# EasyEDA Pro project esp-college-project_bkymsryt-aeef78a5.epro, schematic SCH-ESP-SensairShuttle-MainBoard-V1_1

## Sheets
1 Interface: Board Name: ESP-SensairShuttle-MainBoard-V1_0; Create Date: 2025-10-17; Page Name: Interface; Project Name: ESP-SensairShuttle; Schematic Name: SCH-ESP-SensairShuttle-MainBoard-V1_0; Update Date: 2025-12-12; Company: Espressif
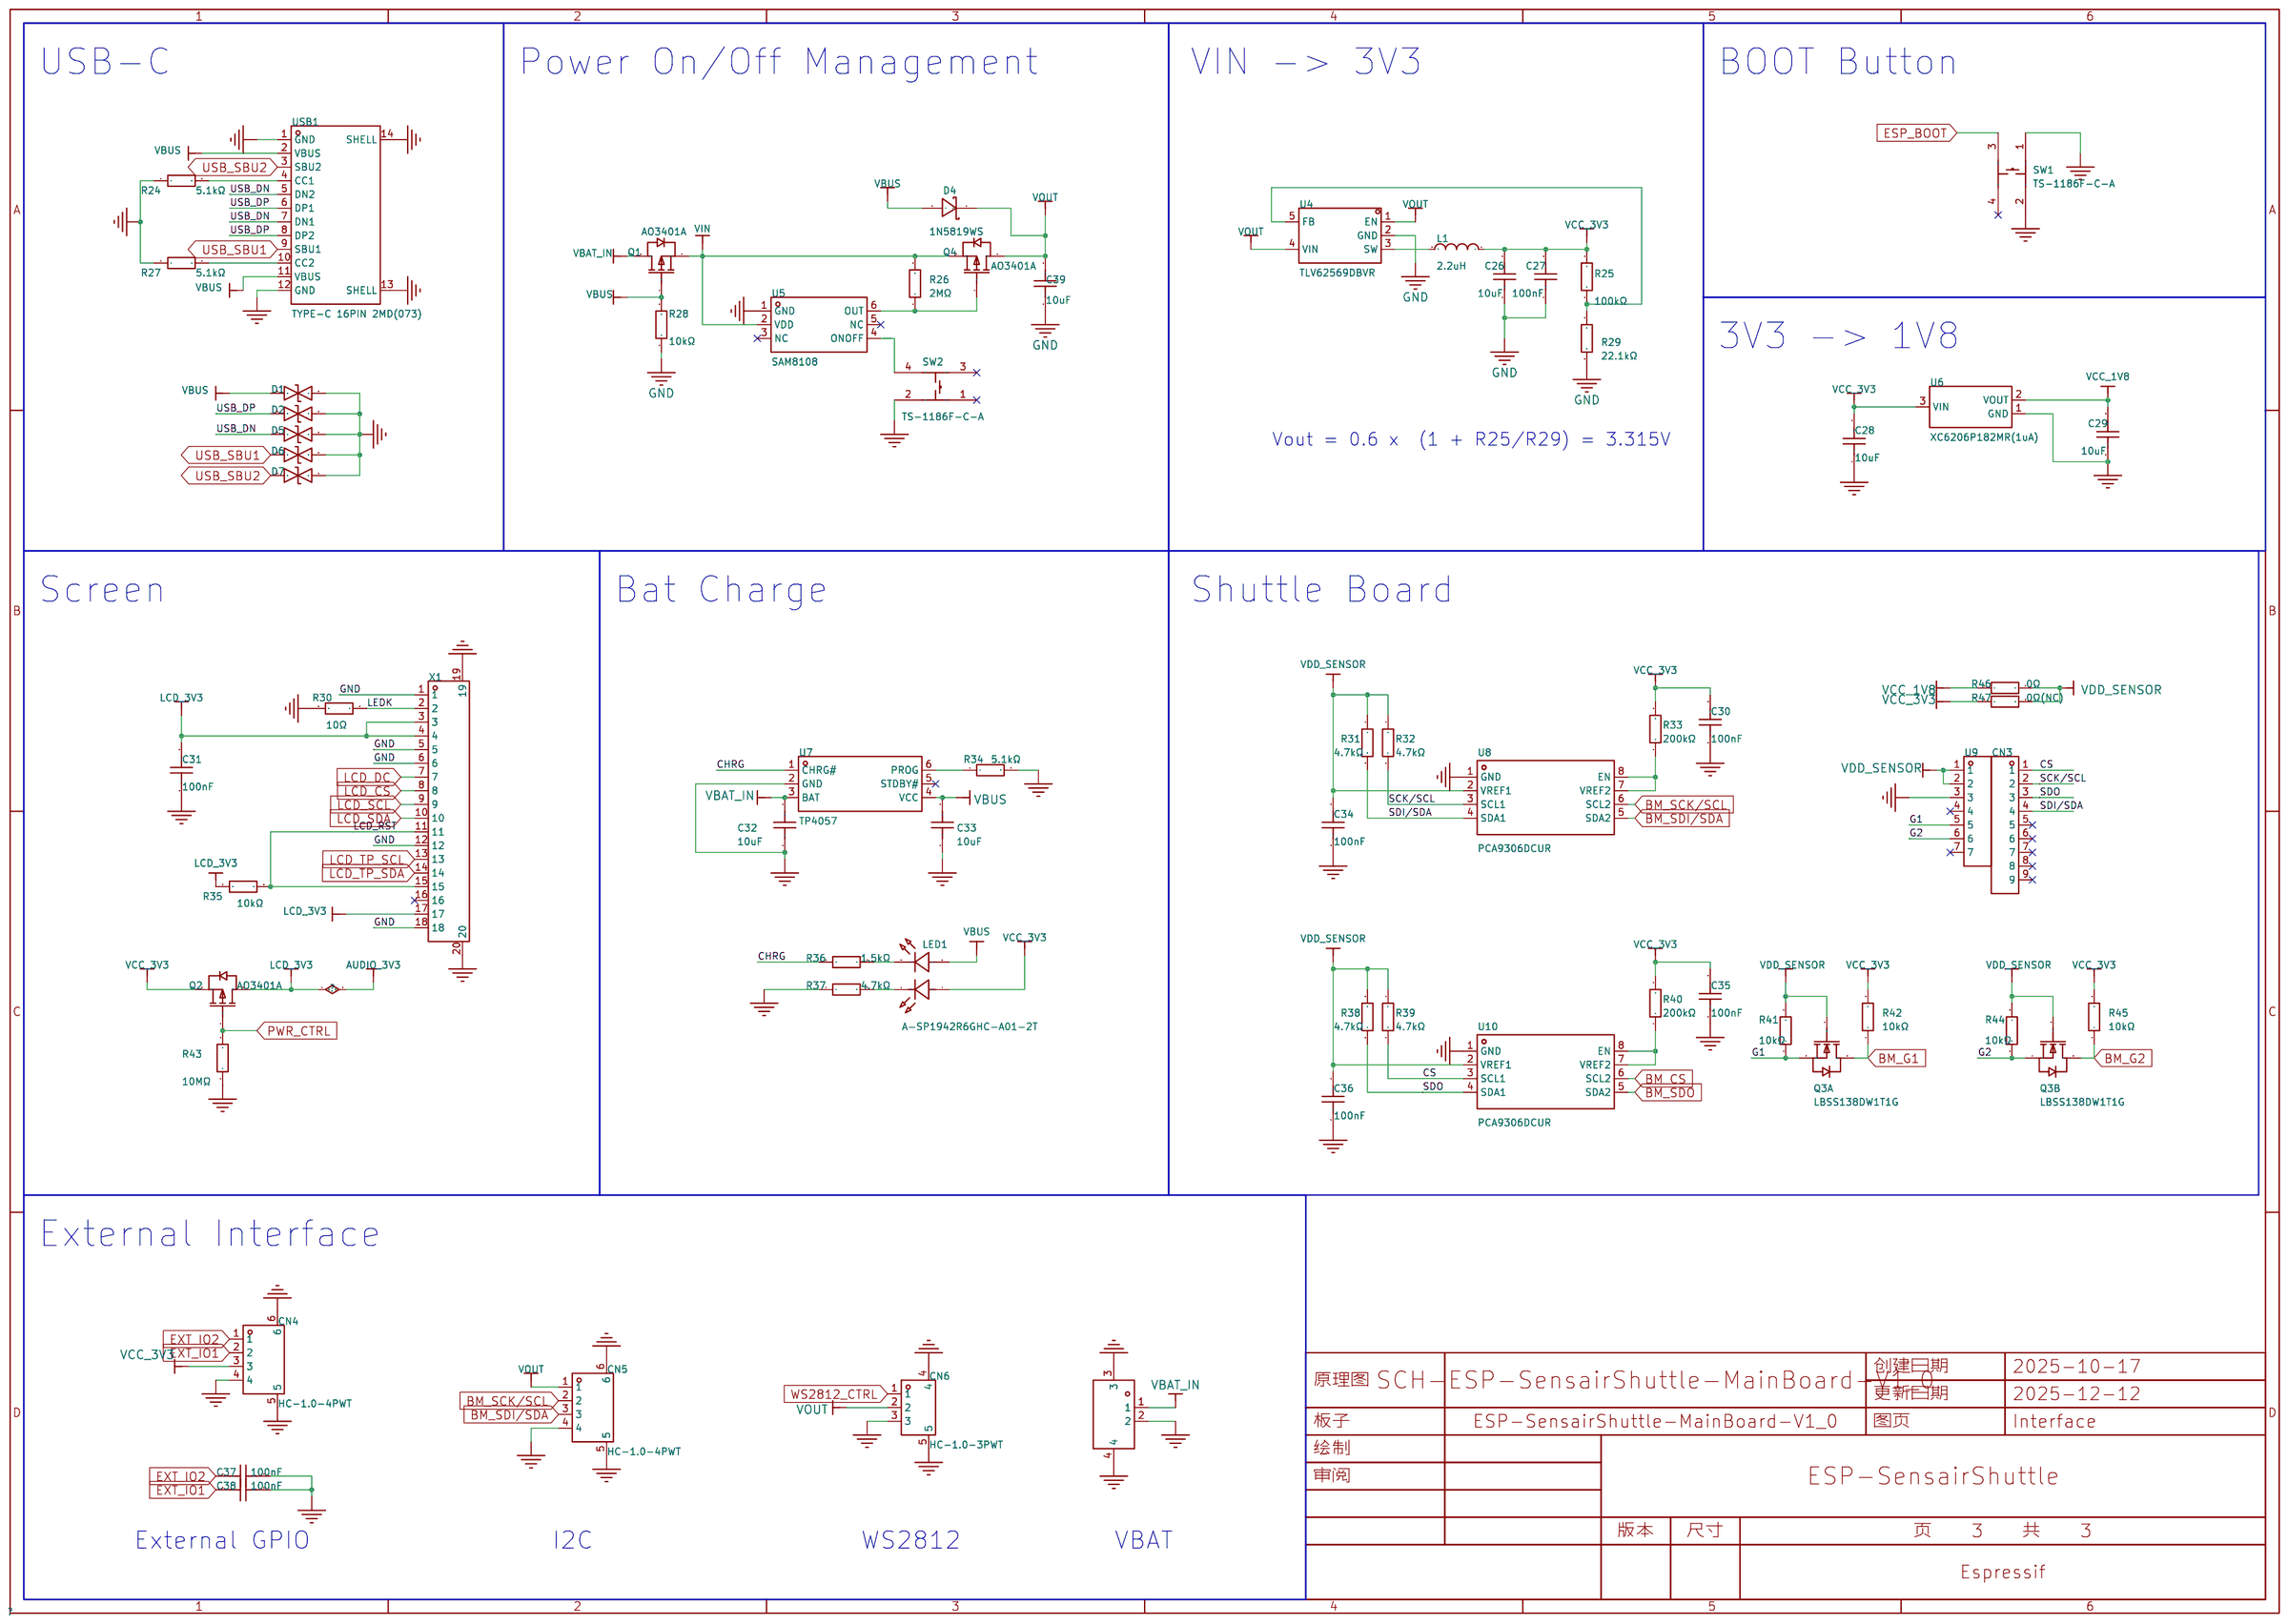
[diagram p1: Interface]
2 MCU & Audio: Page Name: MCU & Audio
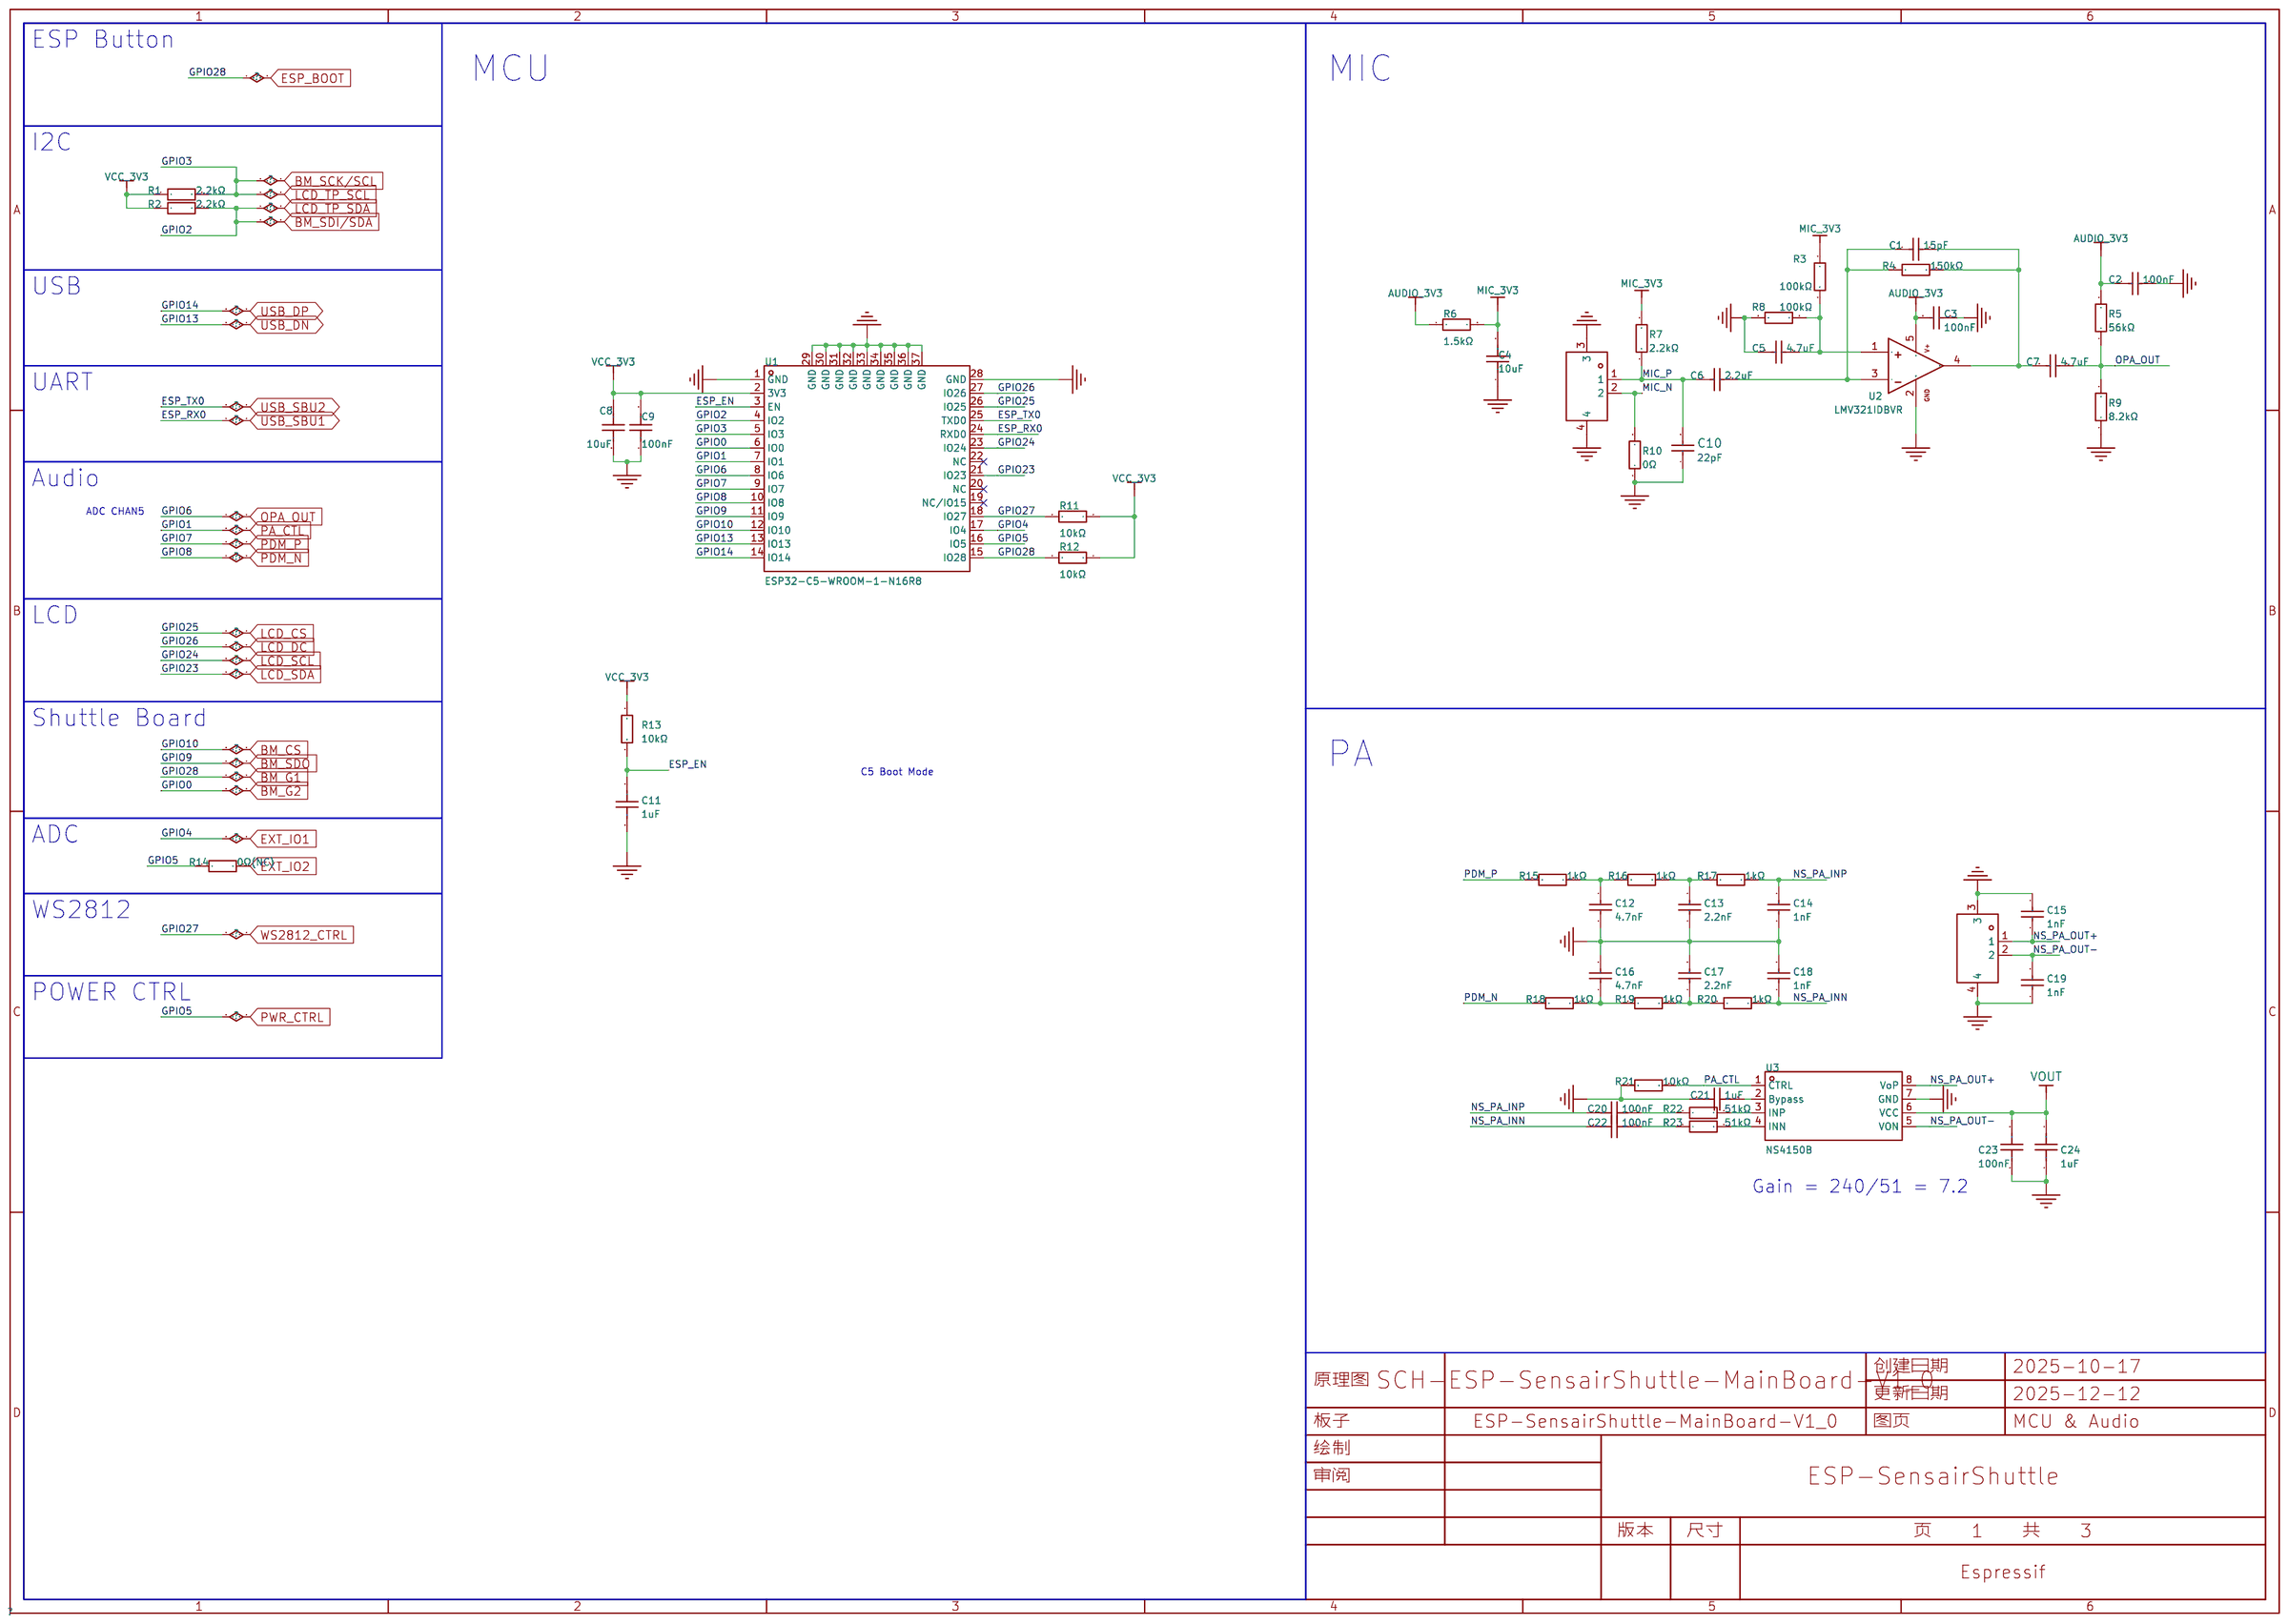
[diagram p2: MCU & Audio]
3 Block: Create Date: 2025-12-12; Page Name: Block; Update Date: 2025-12-16
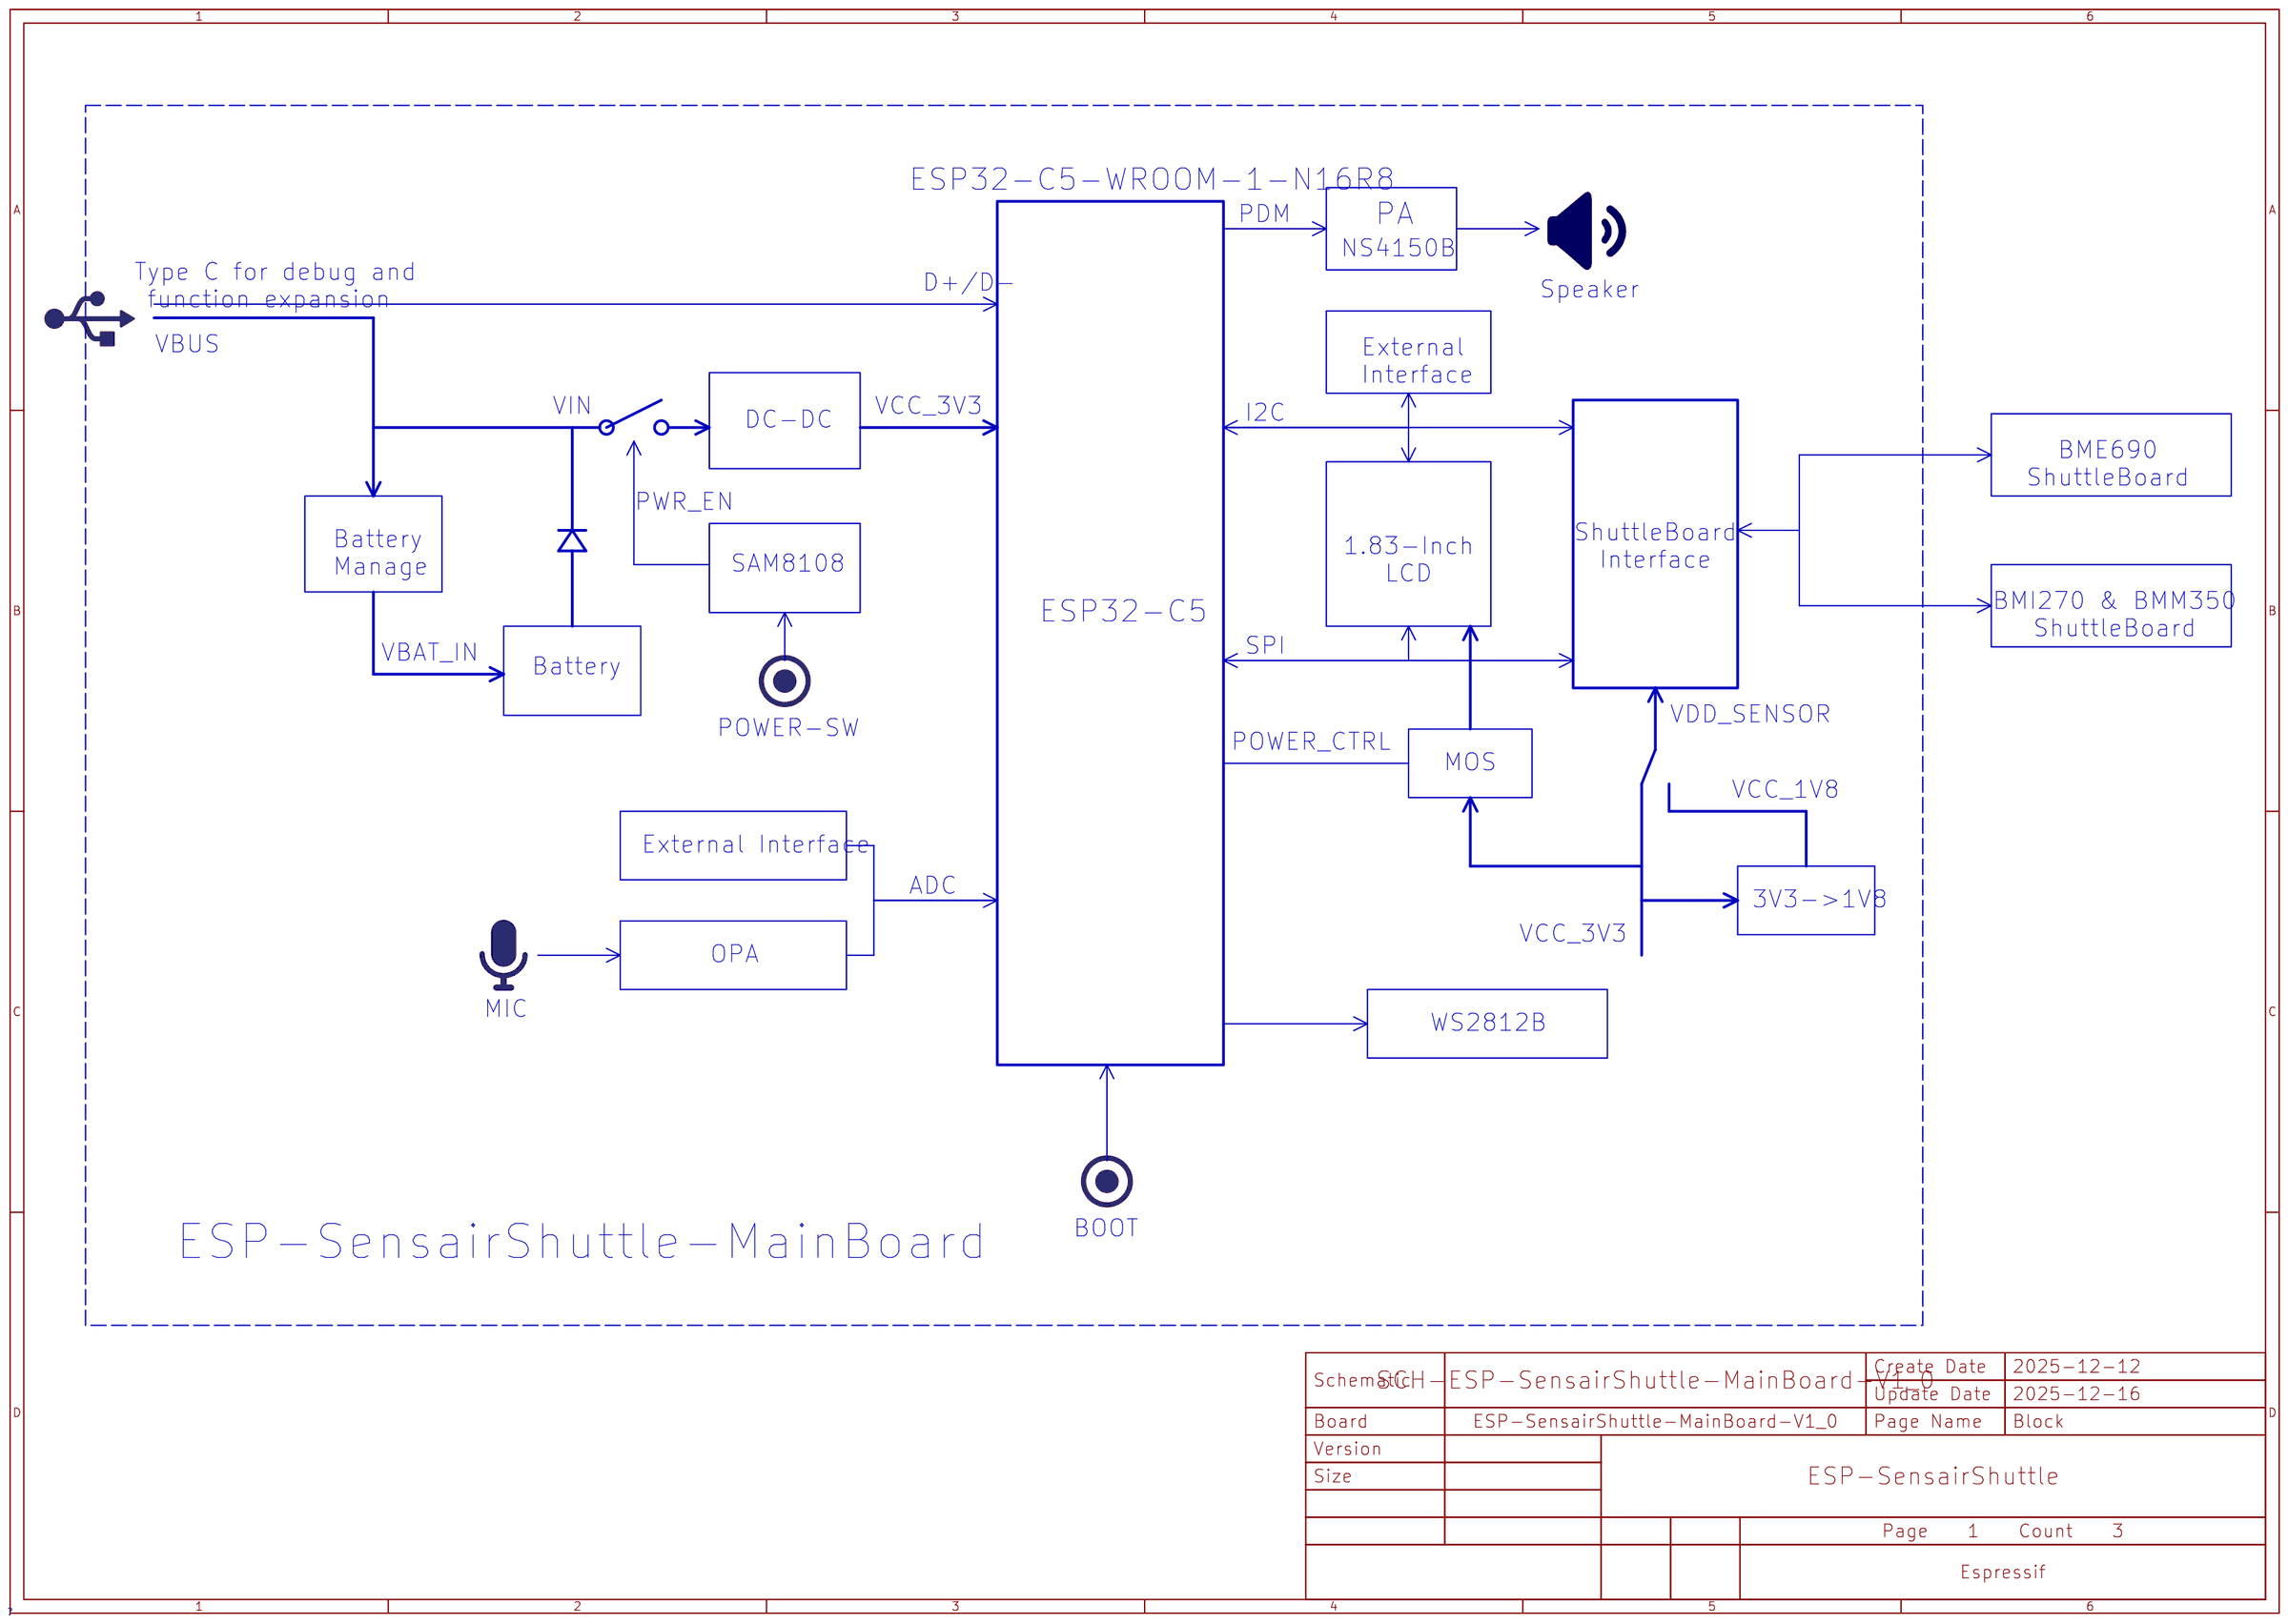
[diagram p3: Block]

## Parts
sheet Interface
C26  10uF  [C0402]
C27  100nF  [C0402]
C28  10uF  [C0402]
C29  10uF  [C0402]
C30  100nF  [C0402]
C31  100nF  [C0402]
C32  10uF  [C0402]
C33  10uF  [C0402]
C34  100nF  [C0402]
C35  100nF  [C0402]
C36  100nF  [C0402]
C37  100nF  [C0402]
C38  100nF  [C0402]
C39  10uF  [C0402]
CN3  X1311FVS-09-C43D35R1  [HDR-SMD_9P-P1.27-V-F_R1]
CN4  HC-1.0-4PWT  [CONN-SMD_4P-P1.00_HCTL_HC-1.0-4PWT]
CN5  HC-1.0-4PWT  [CONN-SMD_4P-P1.00_HCTL_HC-1.0-4PWT]
CN6  HC-1.0-3PWT  [CONN-SMD_3P-P1.0-HC-1.0-3PWT]
CN7  HC-1.25-2PWT  [CONN-SMD_2P-P1.25-HC-1.25-2PWT]
D1  LESD5D5.0CT1G  [SOD-523_L1.2-W0.8-LS1.6-BI]
D2  LESD5D5.0CT1G  [SOD-523_L1.2-W0.8-LS1.6-BI]
D4  1N5819WS  [SOD-323_L1.8-W1.3-LS2.5-RD]
D5  LESD5D5.0CT1G  [SOD-523_L1.2-W0.8-LS1.6-BI]
D6  LESD5D5.0CT1G  [SOD-523_L1.2-W0.8-LS1.6-BI]
D7  LESD5D5.0CT1G  [SOD-523_L1.2-W0.8-LS1.6-BI]
L1  2.2uH  [IND-SMD_L2.5-W2.0_MHCHL2520]
LED1  A-SP1942R6GHC-A01-2T  [LED-SMD_4P-L1.6-W1.5_F.1615.00003-P4-1615R1G1TA2-06T-001]
Q1  AO3401A  [SOT-23_L2.9-W1.3-P1.90-LS2.4-BR]
Q2  AO3401A  [SOT-23_L2.9-W1.3-P1.90-LS2.4-BR]
Q3  LBSS138DW1T1G  [SC-88-6_L2.0-W1.3-P0.65-LS2.1-BL]  (sections 1,2)
Q4  AO3401A  [SOT-23_L2.9-W1.3-P1.90-LS2.4-BR]
R24  5.1kΩ  [R0402]
R25  100kΩ  [R0402_1]
R26  2MΩ  [R0402]
R27  5.1kΩ  [R0402]
R28  10kΩ  [R0402]
R29  22.1kΩ  [R0402_1]
R30  10Ω  [R0402_1]
R31  4.7kΩ  [R0402]
R32  4.7kΩ  [R0402]
R33  200kΩ  [R0402]
R34  5.1kΩ  [R0402]
R35  10kΩ  [R0402_1]
R36  1.5kΩ  [R0402]
R37  4.7kΩ  [R0402]
R38  4.7kΩ  [R0402]
R39  4.7kΩ  [R0402]
R40  200kΩ  [R0402]
R41  10kΩ  [R0402_1]
R42  10kΩ  [R0402_1]
R43  10MΩ  [R0402]
R44  10kΩ  [R0402_1]
R45  10kΩ  [R0402_1]
R46  0Ω  [R0603]
R47  0Ω(NC)  [R0603]
SW1  TS-1186F-C-A  [KEY-SMD_TS-1186F-C-A]
SW2  TS-1186F-C-A  [KEY-SMD_TS-1186F-C-A]
U4  TLV62569DBVR  [SOT-23-5_L3.0-W1.7-P0.95-LS2.8-BR]
U5  SAM8108  [SOT-23-6_L2.9-W1.6-P0.95-LS2.8-BL]
U6  XC6206P182MR(1uA)  [SOT-23-3_L2.9-W1.6-P1.90-LS2.8-BR]
U7  TP4057  [SOT-23-6_L2.9-W1.6-P0.95-LS2.8-BR]
U8  PCA9306DCUR  [SSOP-8_L2.0-W2.3-P0.50-LS3.1-BR]
U9  X1311FVS-07-C43D35R1  [HDR-SMD_7P-P1.27-V-F-LS3.5_XKB_R1]
U10  PCA9306DCUR  [SSOP-8_L2.0-W2.3-P0.50-LS3.1-BR]
USB1  TYPE-C 16PIN 2MD(073)  [USB-C-SMD_TYPE-C-6PIN-2MD-073]
X1  AFC07-S18ECA-00  [FPC-SMD_AFC07-S18ECA-00]
sheet MCU & Audio
C1  15pF  [C0402]
C2  100nF  [C0402]
C3  100nF  [C0402]
C4  10uF  [C0402]
C5  4.7uF  [C0402]
C6  2.2uF  [C0402]
C7  4.7uF  [C0402]
C8  10uF  [C0402]
C9  100nF  [C0402]
C10  22pF  [C0402_1]
C11  1uF  [C0402]
C12  4.7nF  [C0402]
C13  2.2nF  [C0402]
C14  1nF  [C0402]
C15  1nF  [C0402]
C16  4.7nF  [C0402]
C17  2.2nF  [C0402]
C18  1nF  [C0402]
C19  1nF  [C0402]
C20  100nF  [C0402]
C21  1uF  [C0402]
C22  100nF  [C0402]
C23  100nF  [C0402]
C24  1uF  [C0402]
CN1  HC-1.25-2PWT  [CONN-SMD_2P-P1.25-HC-1.25-2PWT]
CN2  HC-1.25-2PWT  [CONN-SMD_2P-P1.25-HC-1.25-2PWT]
R1  2.2kΩ  [R0402]
R2  2.2kΩ  [R0402]
R3  100kΩ  [R0402_1]
R4  150kΩ  [R0402]
R5  56kΩ  [R0402]
R6  1.5kΩ  [R0402]
R7  2.2kΩ  [R0402]
R8  100kΩ  [R0402_1]
R9  8.2kΩ  [R0402]
R10  0Ω  [R0402_1]
R11  10kΩ  [R0402_1]
R12  10kΩ  [R0402_1]
R13  10kΩ  [R0402_1]
R14  0Ω(NC)  [R0402_1]
R15  1kΩ  [R0402]
R16  1kΩ  [R0402]
R17  1kΩ  [R0402]
R18  1kΩ  [R0402]
R19  1kΩ  [R0402]
R20  1kΩ  [R0402]
R21  10kΩ  [R0402_1]
R22  51kΩ  [R0402]
R23  51kΩ  [R0402]
U1  ESP32-C5-WROOM-1-N16R8  [SMT-ESP32-C5-WROOM-1]
U2  LMV321IDBVR  [SOT-23-5_L3.0-W1.7-P0.95-LS2.8-BR_1]
U3  NS4150B  [MSOP-8_L3.0-W3.0-P0.65-LS5.0-BL]

## Library data of the parts
C4 C8 C26 C29 C39 = CL05A106MQ5NUNC: 容值:10uF;精度:±20%;额定电压:6.3V;温度系数:X5R;; LCSC Part Name: 10uF ±20% 6.3V; Supplier Part: C15525; Manufacturer: SAMSUNG(三星); Supplier Footprint: 0402; JLCPCB Part Class: Basic Part; Datasheet: https://item.szlcsc.com/datasheet/CL05A106MQ5NUNC/16204.html; Supplier: LCSC; Tolerance: ±20%; Voltage Rated: 6.3V; Temperature Coefficient: X5R; Voltage Rating: 6.3V
C2 C3 C9 C20 C22 C27 C30 C31 C34-C38 = CL05B104KO5NNNC: 容值:100nF;精度:±10%;额定电压:16V;材质(温度系数):X7R;; LCSC Part Name: 100nF ±10% 16V; Supplier Part: C1525; Manufacturer: SAMSUNG(三星); Supplier Footprint: 0402; JLCPCB Part Class: 基础库; Datasheet: https://atta.szlcsc.com/upload/public/pdf/source/20160218/1457707763339.pdf; Supplier: LCSC; Tolerance: ±10%; Voltage Rated: 16V; Temperature Coefficient: X7R
C28 = CL05A106MQ5NUNC: 容值:10uF;精度:±20%;额定电压:6.3V;温度系数:X5R;; LCSC Part Name: 10uF±20%6.3V; Supplier Part: C15525; Manufacturer: SAMSUNG(三星); Supplier Footprint: 0402; JLCPCB Part Class: BasicPart; Datasheet: https://atta.szlcsc.com/upload/public/pdf/source/20220823/2B02EE04F8F211D38A52DCB16EB6BEBA.pdf; Supplier: LCSC; Tolerance: ±20%; Voltage Rated: 6.3V; Temperature Coefficient: X5R; Voltage Rating: 6.3V
C32 C33 = HGC0402R5106M100NTEJ: 容值:10uF;精度:±20%;额定电压:10V;材质(温度系数):X5R;; LCSC Part Name: 10uF ±20% 10V; Supplier Part: C7472949; Manufacturer: Chinocera(华瓷); Supplier Footprint: 0402; JLCPCB Part Class: Extended Part; Datasheet: https://atta.szlcsc.com/upload/public/pdf/source/20240320/FAC3FEC40A78BC5CCCE96C232A94D860.pdf; Supplier: LCSC; Tolerance: ±20%; Voltage Rated: 10V; Temperature Coefficient: X5R
CN3 = X1311FVS-09-C43D35R1: 插孔结构:1x9P;间距:1.27mm;行距:-;圆孔/方孔:方孔;安装类型:立贴;排数:单排;总孔位数:9P;额定电流:1A;额定电压:250V;插孔方向:顶部;塑高:4.3mm;触头材质:黄铜;触头镀层:金;工作温度范围:-40℃~+105℃;焊接温度(最大值):260℃;; LCSC Part Name: 间距:1.27mm 1x9P 立贴; Supplier Part: C2881499; Manufacturer: XKB Connection(中国星坤); Supplier Footprint: SMD,P=1.27mm(交错脚); JLCPCB Part Class: Extended Part; Datasheet: https://atta.szlcsc.com/upload/public/pdf/source/20211011/0A98DB21FA5DE73171AE3D6ADB4E7C8C.pdf; Supplier: LCSC; Holes Structure: 1x9P; Pitch: 1.27mm; Circular Hole / Square Hole: 方孔; Mounting Type: 立贴; Number of Rows: 单排; Number of Holes: 9P; Current Rating (Max): 1A; Voltage Rating (Max): 250V; Holes Direction: 顶部; Insulation Height: 4.3mm; Contact Material: 黄铜; Contact Plating: 金; Operating Temperature Range: -40℃~+105℃; Soldering Temperature(Max): 260℃
CN4 CN5 = HC-1.0-4PWT: 插针结构:1x4P;间距:1mm;安装方式:卧贴;参考系列:SH;总PIN数:4P;排数:1;每排PIN数:4;行距:-;额定电流:1A;触头材质:磷青铜;触头镀层:锡;工作温度:-25℃~+85℃;; LCSC Part Name: 1x4P 间距:1mm 卧贴 系列:SH; Supplier Part: C2845363; Manufacturer: HCTL(华灿天禄); Supplier Footprint: SMD,P=1mm,卧贴; JLCPCB Part Class: 扩展库; Datasheet: https://item.szlcsc.com/datasheet/HC-1.0-4PWT/3039044.html; Supplier: LCSC; Pins Structure: 1x4P; Pitch: 1mm; Mounting Type: 卧贴; Reference Series: SH; Number of Pins: 4P; Number of Rows: 1; Number of PINs Per Row: 4; Current Rating: 1A; Contact Material: 磷青铜; Contact Plating: 锡; Operating Temperature: -25℃~+85℃; Voltage Rating: 50V; Plastic Material: LCP; Flame Retardant Rating: UL94V-0; Supplementary Features: 辅助焊脚; Z-Height of the Board: 3.2mm; X-Length of Bottom Edge on Board (Spacing Line): 6.3mm; Y-Width of Bottom Edge on Board: 5.05mm
CN6 = HC-1.0-3PWT: 插针结构:1x3P;间距:1mm;安装方式:卧贴;参考系列:SH;总PIN数:3P;排数:1;每排PIN数:3;行距:-;额定电流:1A;触头材质:磷青铜;触头镀层:锡;工作温度范围:-25℃~+85℃;; LCSC Part Name: 1x3P 间距:1mm 卧贴 系列:SH; Supplier Part: C2845362; Manufacturer: HCTL(华灿天禄); Supplier Footprint: SMD,P=1mm,卧贴; Datasheet: https://atta.szlcsc.com/upload/public/pdf/source/20230707/696F47DD5B3D5495B4AB8BCE302E8A84.pdf; Supplier: LCSC; Pins Structure: 1x3P; Pitch: 1mm; Mounting Style: 卧贴; Reference Series: SH; Number of Pins: 3P; Number of Rows: 1; Number of PINs Per Row: 3; Current Rating (Max): 1A; Contact Material: 磷青铜; Contact Plating: 锡; Operating Temperature Range: -25℃~+85℃; Rated Voltage (Max): 50V; Plastic Material: LCP; Flame Retardant Rating: UL94V-0; Supplementary Features: 辅助焊脚; Z-Height of the Board: 3.2mm; X-Length of Bottom Edge on Board (Spacing Line): 5.3mm; Y-Width of Bottom Edge on Board: 5.05mm
CN1 CN2 CN7 = HC-1.25-2PWT: 插针结构:1x2P;间距:1.25mm;安装方式:卧贴;参考系列:PicoBlade(MX 1.25);总PIN数:2P;排数:1;每排PIN数:2;行距:-;额定电流:1A;触头材质:黄铜;触头镀层:锡;工作温度范围:-40℃~+105℃;; LCSC Part Name: 1x2P 间距:1.25mm 卧贴 系列:PicoBlade(MX 1.25); Supplier Part: C2845379; Manufacturer: HCTL(华灿天禄); Supplier Footprint: SMD,P=1.25mm,卧贴; JLCPCB Part Class: Extended Part; Datasheet: https://atta.szlcsc.com/upload/public/pdf/source/20240930/9508A8292CCC87B0C29E3A028D56E30A.pdf; Supplier: LCSC; Pins Structure: 1x2P; Pitch: 1.25mm; Mounting Style: 卧贴; Reference Series: PicoBlade(MX 1.25); Number of Pins: 2P; Number of Rows: 1; Number of PINs Per Row: 2; Current Rating (Max): 1A; Contact Material: 黄铜; Contact Plating: 锡; Operating Temperature Range: -40℃~+105℃; Rated Voltage (Max): 125V; Plastic Material: LCP; Flame Retardant Rating: UL94V-0; Supplementary Features: 辅助焊脚; Z-Height of the Board: 3.57mm; X-Length of Bottom Edge on Board (Spacing Line): 7.55mm; Y-Width of Bottom Edge on Board: 5.25mm
D1 D2 D5-D7 = LESD5D5.0CT1G: LCSC Part Name: 双向ESD; Supplier Part: C383211; Manufacturer: LRC(乐山无线电); Supplier Footprint: SOD-523; JLCPCB Part Class: 扩展库; Datasheet: https://atta.szlcsc.com/upload/public/pdf/source/20190807/C383211_633DF4B4E2C161403226E5235FE33A1C.pdf; Supplier: LCSC
D4 = 1N5819WS_C191023: 正向压降(Vf):600mV@1A;直流反向耐压(Vr):40V;整流电流:1A;; LCSC Part Name: 电压:40V 电流:1A; Supplier Part: C191023; Manufacturer: Hottech(合科泰); Supplier Footprint: SOD-323; JLCPCB Part Class: 基础库; Datasheet: https://atta.szlcsc.com/upload/public/pdf/source/20220428/3CB86FD8D28D653594B4E35F9D5AEFD9.pdf; Supplier: LCSC; Forward Voltage (Vf@If): 600mV@1A; Reverse Voltage (Vr): 40V; Rectified Current: 1A; Average Rectified Current (Io): 1A
L1 = FTC252012S2R2MBCA: 电感值:2.2uH;精度:±20%;额定电流:3A;饱和电流(Isat):3.8A;类型:一体成型电感;; LCSC Part Name: 2.2uH ±20% 3.8A; Supplier Part: C5832372; Manufacturer: cjiang(长江微电); Supplier Footprint: 1008; JLCPCB Part Class: 扩展库; Datasheet: https://atta.szlcsc.com/upload/public/pdf/source/20230602/8FFEDA9C0247A92A0D4B67554BFE4091.pdf; Supplier: LCSC; Tolerance: ±20%; Rated Current: 3A; Saturation Current (Isat): 3.8A; DC Resistance (DCR): 55mΩ; Type: 一体成型电感
LED1 = A-SP1942R6GHC-A01-2T: 发光颜色:红色,翠绿色;正向压降(Vf):2.5V~3.1V；1.6V~2.1V;功率:95mW；60mW;正向电流:5mA;波长:520nm~535nm；616nm~626nm;透镜颜色:无色透明透镜;发光强度:28.5mcd~72mcd；180mcd~450mcd;发光角度:130°;载带方式:正贴;工作温度:-40℃~+80℃;; LCSC Part Name: 1615红绿双色正贴; Supplier Part: C19171224; Manufacturer: Amicc(欧密格光电); Supplier Footprint: SMD-4P,1.6x1.5mm; JLCPCB Part Class: 扩展库; Datasheet: https://item.szlcsc.com/datasheet/A-SP1942R6GHC-A01-2T/20382131.html; Supplier: LCSC; Illumination Color: 红色,翠绿色; Voltage - Forward(Vf): 2.5V~3.1V；1.6V~2.1V; Power(Watts): 95mW；60mW; Forward Current: 5mA; Wavelength - Dominant: 520nm~535nm；616nm~626nm; Peak Wavelength: 632nm；516nm; Lens Color: 无色透明透镜; Luminous Intensity: 28.5mcd~72mcd；180mcd~450mcd; Viewing Angle: 130°; Mounting Style: 正贴; Operating Temperature: -40℃~+80℃
Q1 Q2 Q4 = AO3401A_C15127: 类型:1个P沟道;漏源电压(Vdss):30V;连续漏极电流(Id):4A;导通电阻(RDS(on)@Vgs,Id):44mΩ@10V,4.3A;功率(Pd):1.4W;阈值电压(Vgs(th)@Id):1.3V@250uA;; LCSC Part Name: P沟道 30V 4A; Supplier Part: C15127; Manufacturer: AOS; Supplier Footprint: SOT-23; JLCPCB Part Class: Basic Part; Datasheet: https://atta.szlcsc.com/upload/public/pdf/source/20160507/1462613609053.pdf; Supplier: LCSC; Type: 1个P沟道; Drain Source Voltage (Vdss): 30V; Continuous Drain Current (Id): 4A; Drain Source On Resistance (RDS(on)@Vgs,Id): 44mΩ@10V,4.3A; Power Dissipation (Pd): 1.4W; Gate Threshold Voltage (Vgs(th)@Id): 1.3V@250uA; Total Gate Charge (Qg@Vgs): 12.2nC@4.5V; Input Capacitance (Ciss@Vds): 1.2nF@15V; Operating Temperature: -55℃~+150℃@(Tj)
Q3 = LBSS138DW1T1G: 类型:2个N沟道;漏源电压(Vdss):50V;连续漏极电流(Id):200mA;导通电阻(RDS(on)@Vgs,Id):5.6Ω@2.75V,200mA;功率:225mW;阈值电压(Vgs(th)@Id):500mV@1mA;; LCSC Part Name: 2个N沟道 耐压:50V 电流:200mA; Supplier Part: C525406; Manufacturer: LRC(乐山无线电); Supplier Footprint: SC-88; JLCPCB Part Class: 扩展库; Datasheet: https://atta.szlcsc.com/upload/public/pdf/source/20200430/C525406_6366B5610902164BCE9580E47653FB6E.pdf; Supplier: LCSC; Type: 2个N沟道; Drain Source Voltage (Vdss): 50V; Continuous Drain Current (Id): 200mA; Drain Source On Resistance (RDS(on)@Vgs,Id): 5.6Ω@2.75V,200mA; Power Dissipation (Pd): 225mW; Gate Threshold Voltage (Vgs(th)@Id): 500mV@1mA; Input Capacitance (Ciss@Vds): 50pF@25V; Reverse Transfer Capacitance (Crss@Vds): 5pF@25V; Operating Temperature: -55℃~+150℃
R24 R27 = 0402WGF5101TCE: 电阻类型:厚膜电阻;阻值:5.1kΩ;精度:±1%;功率:62.5mW;最大工作电压:50V;温度系数:±100ppm/℃;; LCSC Part Name: 5.1kΩ ±1% 62.5mW 厚膜电阻; Supplier Part: C25905; Manufacturer: UNI-ROYAL(厚声); Supplier Footprint: 0402; JLCPCB Part Class: Basic Part; Datasheet: https://atta.szlcsc.com/upload/public/pdf/source/20200306/C422600_1E6D84923E4A46A82E41ADD87F860B5C.pdf; Supplier: LCSC; Type: 厚膜电阻; Tolerance: ±1%; Power(Watts): 62.5mW; Overload Voltage (Max): 50V; Temperature Coefficient: ±100ppm/℃; Operating Temperature Range: -55℃~+155℃
R3 R8 R25 = 0402WGF1003TCE: 电阻类型:厚膜电阻;阻值:100kΩ;精度:±1%;功率:62.5mW;; LCSC Part Name: 100kΩ ±1% 62.5mW; Supplier Part: C25741; Manufacturer: UNI-ROYAL(厚声); Supplier Footprint: 0402; JLCPCB Part Class: 基础库; Datasheet: https://atta.szlcsc.com/upload/public/pdf/source/20200306/C422600_1E6D84923E4A46A82E41ADD87F860B5C.pdf; Supplier: LCSC; Type: 厚膜电阻; Tolerance: ±1%; Power(Watts): 62.5mW; Temperature Coefficient: ±100ppm/℃; Overload Voltage (Max): 50V; Operating Temperature Range: -55℃~+155℃
R26 = RC0402FR-072ML: 电阻类型:厚膜电阻;阻值:2MΩ;精度:±1%;功率:62.5mW;最大工作电压:50V;温度系数:±100ppm/℃;; LCSC Part Name: 厚膜电阻 2MΩ ±1% 62.5mW; Supplier Part: C138014; Manufacturer: YAGEO(国巨); Supplier Footprint: 0402; JLCPCB Part Class: Extended Part; Datasheet: https://atta.szlcsc.com/upload/public/pdf/source/20181009/C309620_DA5935B6E1D48212CB7A533FE518B3C2.pdf; Supplier: LCSC; Type: 厚膜电阻; Tolerance: ±1%; Power(Watts): 62.5mW; Overload Voltage (Max): 50V; Temperature Coefficient: ±100ppm/℃; Operating Temperature Range: -55℃~+155℃
R28 = 0402WGF1002TCE: 电阻类型:厚膜电阻;阻值:10kΩ;精度:±1%;功率:62.5mW;工作电压:50V;温度系数:±100ppm/℃;; LCSC Part Name: 10kΩ ±1% 62.5mW 厚膜电阻; Supplier Part: C25744; Manufacturer: UNI-ROYAL(厚声); Supplier Footprint: 0402; JLCPCB Part Class: Basic Part; Datasheet: https://item.szlcsc.com/datasheet/0402WGF1002TCE/26487.html; Supplier: LCSC; Type: 厚膜电阻; Tolerance: ±1%; Power(Watts): 62.5mW; Temperature Coefficient: ±100ppm/℃; Overload Voltage (Max): 50V; Operating Temperature Range: -55℃~+155℃; Voltage-Supply(Max): 50V; Operating Temperature: -55℃~+155℃
R29 = 0402WGF2212TCE: 电阻类型:厚膜电阻;阻值:22.1kΩ;精度:±1%;功率:62.5mW;最大工作电压:50V;温度系数:±100ppm/℃;; LCSC Part Name: 22.1kΩ ±1% 62.5mW 厚膜电阻; Supplier Part: C43473; Manufacturer: UNI-ROYAL(厚声); Supplier Footprint: 0402; JLCPCB Part Class: Extended Part; Datasheet: https://atta.szlcsc.com/upload/public/pdf/source/20200306/C422600_1E6D84923E4A46A82E41ADD87F860B5C.pdf; Supplier: LCSC; Type: 厚膜电阻; Tolerance: ±1%; Power(Watts): 62.5mW; Overload Voltage (Max): 50V; Temperature Coefficient: ±100ppm/℃; Operating Temperature Range: -55℃~+155℃
R30 = 0402WGF100JTCE: 电阻类型:厚膜电阻;阻值:10Ω;精度:±1%;功率:62.5mW;最大工作电压:50V;温度系数:±200ppm/℃;; LCSC Part Name: 10Ω ±1% 62.5mW 厚膜电阻; Supplier Part: C25077; Manufacturer: UNI-ROYAL(厚声); Supplier Footprint: 0402; JLCPCB Part Class: Basic Part; Datasheet: https://atta.szlcsc.com/upload/public/pdf/source/20200306/C422600_1E6D84923E4A46A82E41ADD87F860B5C.pdf; Supplier: LCSC; Type: 厚膜电阻; Tolerance: ±1%; Power(Watts): 62.5mW; Overload Voltage (Max): 50V; Temperature Coefficient: ±200ppm/℃; Operating Temperature Range: -55℃~+155℃
R31 R32 R38 R39 = 0402WGF4701TCE: 电阻类型:厚膜电阻;阻值:4.7kΩ;精度:±1%;功率:62.5mW;最大工作电压:50V;温度系数:±100ppm/℃;; LCSC Part Name: 4.7kΩ ±1% 62.5mW 厚膜电阻; Supplier Part: C25900; Manufacturer: UNI-ROYAL(厚声); Supplier Footprint: 0402; JLCPCB Part Class: Basic Part; Datasheet: https://atta.szlcsc.com/upload/public/pdf/source/20200306/C422600_1E6D84923E4A46A82E41ADD87F860B5C.pdf; Supplier: LCSC; Type: 厚膜电阻; Tolerance: ±1%; Power(Watts): 62.5mW; Overload Voltage (Max): 50V; Temperature Coefficient: ±100ppm/℃; Operating Temperature Range: -55℃~+155℃
R33 R40 = 0402WGF2003TCE: 电阻类型:厚膜电阻;阻值:200kΩ;精度:±1%;功率:62.5mW;最大工作电压:50V;温度系数:±100ppm/℃;; LCSC Part Name: 200kΩ ±1% 62.5mW 厚膜电阻; Supplier Part: C25764; Manufacturer: UNI-ROYAL(厚声); Supplier Footprint: 0402; JLCPCB Part Class: Basic Part; Datasheet: https://atta.szlcsc.com/upload/public/pdf/source/20200306/C422600_1E6D84923E4A46A82E41ADD87F860B5C.pdf; Supplier: LCSC; Type: 厚膜电阻; Tolerance: ±1%; Power(Watts): 62.5mW; Overload Voltage (Max): 50V; Temperature Coefficient: ±100ppm/℃; Operating Temperature Range: -55℃~+155℃
R34 = 0402WGF5101TCE: 电阻类型:厚膜电阻;阻值:5.1kΩ;精度:±1%;功率:62.5mW;工作电压:50V;温度系数:±100ppm/℃;; LCSC Part Name: 5.1kΩ ±1% 62.5mW 厚膜电阻; Supplier Part: C25905; Manufacturer: UNI-ROYAL(厚声); Supplier Footprint: 0402; JLCPCB Part Class: Basic Part; Datasheet: https://item.szlcsc.com/datasheet/0402WGF5101TCE/26648.html; Supplier: LCSC; Type: 厚膜电阻; Tolerance: ±1%; Power(Watts): 62.5mW; Overload Voltage (Max): 50V; Temperature Coefficient: ±100ppm/℃; Operating Temperature Range: -55℃~+155℃; Voltage-Supply(Max): 50V; Operating Temperature: -55℃~+155℃
R35 = 0402WGF1002TCE: 电阻类型:厚膜电阻;阻值:10kΩ;精度:±1%;功率:62.5mW;温度系数:±100ppm/℃;; LCSC Part Name: 厚膜电阻 10kΩ ±1% 62.5mW; Supplier Part: C25744; Manufacturer: UNI-ROYAL(厚声); Supplier Footprint: 0402; JLCPCB Part Class: Basic Part; Datasheet: https://atta.szlcsc.com/upload/public/pdf/source/20200306/C422600_1E6D84923E4A46A82E41ADD87F860B5C.pdf; Supplier: LCSC; Type: 厚膜电阻; Tolerance: ±1%; Power(Watts): 62.5mW; Temperature Coefficient: ±100ppm/℃; Overload Voltage (Max): 50V; Operating Temperature Range: -55℃~+155℃
R36 = 0402WGF1501TCE: 电阻类型:厚膜电阻;阻值:1.5kΩ;精度:±1%;功率:62.5mW;最大工作电压:50V;温度系数:±100ppm/℃;; LCSC Part Name: 1.5kΩ ±1% 62.5mW 厚膜电阻; Supplier Part: C25867; Manufacturer: UNI-ROYAL(厚声); Supplier Footprint: 0402; JLCPCB Part Class: Basic Part; Datasheet: https://atta.szlcsc.com/upload/public/pdf/source/20200306/C422600_1E6D84923E4A46A82E41ADD87F860B5C.pdf; Supplier: LCSC; Type: 厚膜电阻; Tolerance: ±1%; Power(Watts): 62.5mW; Overload Voltage (Max): 50V; Temperature Coefficient: ±100ppm/℃; Operating Temperature Range: -55℃~+155℃
R37 = 0402WGF4701TCE: 电阻类型:厚膜电阻;阻值:4.7kΩ;精度:±1%;功率:62.5mW;工作电压:50V;温度系数:±100ppm/℃;; LCSC Part Name: 4.7kΩ ±1% 62.5mW 厚膜电阻; Supplier Part: C25900; Manufacturer: UNI-ROYAL(厚声); Supplier Footprint: 0402; JLCPCB Part Class: Basic Part; Datasheet: https://item.szlcsc.com/datasheet/0402WGF4701TCE/26643.html; Supplier: LCSC; Type: 厚膜电阻; Tolerance: ±1%; Power(Watts): 62.5mW; Overload Voltage (Max): 50V; Temperature Coefficient: ±100ppm/℃; Operating Temperature Range: -55℃~+155℃; Voltage-Supply(Max): 50V; Operating Temperature: -55℃~+155℃
R11-R13 R41 R42 R44 R45 = 0402WGF1002TCE: 电阻类型:厚膜电阻;阻值:10kΩ;精度:±1%;功率:62.5mW;最大工作电压:50V;温度系数:±100ppm/℃;; LCSC Part Name: 厚膜电阻 10kΩ ±1% 62.5mW; Supplier Part: C25744; Manufacturer: UNI-ROYAL(厚声); Supplier Footprint: 0402; JLCPCB Part Class: Basic Part; Datasheet: https://atta.szlcsc.com/upload/public/pdf/source/20200306/C422600_1E6D84923E4A46A82E41ADD87F860B5C.pdf; Supplier: LCSC; Type: 厚膜电阻; Tolerance: ±1%; Power(Watts): 62.5mW; Temperature Coefficient: ±100ppm/℃; Overload Voltage (Max): 50V; Operating Temperature Range: -55℃~+155℃
R43 = 0402WGF1005TCE: 电阻类型:厚膜电阻;阻值:10MΩ;精度:±1%;功率:62.5mW;最大工作电压:50V;温度系数:±200ppm/℃;; LCSC Part Name: 10MΩ ±1% 62.5mW 厚膜电阻; Supplier Part: C26082; Manufacturer: UNI-ROYAL(厚声); Supplier Footprint: 0402; JLCPCB Part Class: Extended Part; Datasheet: https://atta.szlcsc.com/upload/public/pdf/source/20200306/C422600_1E6D84923E4A46A82E41ADD87F860B5C.pdf; Supplier: LCSC; Type: 厚膜电阻; Tolerance: ±1%; Power(Watts): 62.5mW; Overload Voltage (Max): 50V; Temperature Coefficient: ±200ppm/℃; Operating Temperature Range: -55℃~+155℃
R46 R47 = 0603WAF0000T5E: 电阻类型:厚膜电阻;阻值:0Ω;精度:±1%;功率:100mW;工作电压:75V;温度系数:-;; LCSC Part Name: 0Ω ±1% 100mW 厚膜电阻; Supplier Part: C21189; Manufacturer: UNI-ROYAL(厚声); Supplier Footprint: 0603; JLCPCB Part Class: Basic Part; Datasheet: https://item.szlcsc.com/datasheet/0603WAF0000T5E/21903.html; Supplier: LCSC; Type: 厚膜电阻; Tolerance: ±1%; Power(Watts): 100mW; Voltage-Supply(Max): 75V; Operating Temperature: -55℃~+155℃
SW1 SW2 = TS-1186F-C-A: 电路结构:单刀单掷;按钮形状:矩形按钮;作用力:2.6N;安装方式:卧贴;开关长度:3.6mm;开关宽度:3.5mm;开关高度:-;带支架:不带;触点电流:50mA;额定电压(AC):-;额定电压(DC):12V;绝缘电阻:-;带灯:无;机械寿命:10万次;; LCSC Part Name: 卧贴 轻触开关; Supplier Part: C908471; Manufacturer: XKB Connection(中国星坤); Supplier Footprint: SMD; JLCPCB Part Class: 扩展库; Datasheet: https://atta.szlcsc.com/upload/public/pdf/source/20211011/464E01B21ACC99F15A9CE7AE47C45F88.pdf; Supplier: LCSC; Circuit: 单刀单掷; Actuator Style: 矩形按钮; Operating Force: 2.6N; Mounting Style: 卧贴; Switch Length: 3.6mm; Switch Width: 3.5mm; Strike Gundam: 不带; Contact Current: 50mA; Voltage Rating (DC): 12V; Actuator/Cap Color: 黑色; With Lamp: 无; Mechanical Life: 10万次; Operating Temperature: -30℃~+85℃
U4 = TLV62569DBVR: 功能类型:降压型;输出类型:可调;输入电压:2.5V~5.5V;输出电压:600mV~5.5V;输出电流(最大值):2A;; Supplier Part: C141836; Manufacturer: TI(德州仪器); Supplier Footprint: SOT-23-5; JLCPCB Part Class: 扩展库; Datasheet: https://www.ti.com/cn/lit/gpn/tlv62569; Supplier: LCSC; Function: 降压型; Output Type: 可调; Input Voltage: 2.5V~5.5V; Output Voltage: 600mV~5.5V; Output Current (Max): 2A; Switching Frequency: 1.5MHz; Operating Temperature: -40℃~+125℃@(TJ); Synchronous Rectification: 是; Topology: 降压式; Switch tube (built-in/external): 内置
U5 = SAM8108: Supplier Part: C9900019002; Supplier Footprint: SOT-23-6; JLCPCB Part Class: 扩展库; Supplier: LCSC
U6 = XC6206P182MR(1uA): 输出类型:固定;工作电压:7V;输出电压:1.8V;输出电流:200mA;电源纹波抑制比(PSRR):-;输出极性:正极;; LCSC Part Name: 超低功耗、低压差、线性稳压器; Supplier Part: C2827651; Manufacturer: TECH PUBLIC(台舟); Supplier Footprint: SOT-23-3L; JLCPCB Part Class: 扩展库; Datasheet: https://item.szlcsc.com/datasheet/XC6206P182MR(1uA)/2973333.html; Supplier: LCSC; Output Type: 固定; Voltage - Supply: 7V; Output Voltage: 1.8V; Output Current: 200mA; Voltage Dropout: 70mV@(30mA)；240mV@(100mA); standby current: 1uA; Features: 过流保护；短路保护; Operating Temperature: -25℃~+85℃@(Ta); Output Configuration: 正极; Number of Outputs: 1
U7 = TP4057: 电源电压:6.5V;最大充电电流:500mA;电池类型:锂离子/聚合物;电池节数:1;; Supplier Part: C725791; Manufacturer: UMW(友台半导体); Supplier Footprint: SOT-23-6; JLCPCB Part Class: 扩展库; Datasheet: https://atta.szlcsc.com/upload/public/pdf/source/20231109/7FB39B0490CD1514A6792371FCA0BB30.pdf; Supplier: LCSC; Supply Voltage: 6.5V; Maximum Charge Current: 500mA; Type of Battery: 锂离子/聚合物; Number of Cells: 1; Operating Temperature: -40℃~+85℃
U8 U10 = PCA9306DCUR: 数据速率:-;工作电压(VCCA):1.2V~3.3V;工作电压(VCCB):1.8V~5.5V;通道数:1;每个电路通道数:2;; LCSC Part Name: 2位双向电平转换器; Supplier Part: C33196; Manufacturer: TI(德州仪器); Supplier Footprint: VSSOP-8; JLCPCB Part Class: 扩展库; Datasheet: https://www.ti.com/cn/lit/gpn/pca9306; Supplier: LCSC; Channel Type: 双向; Voltage - Supply(VCCA): 1.2V~3.3V; Voltage - Supply(VCCB): 1.8V~5.5V; Number of Circuits: 2; Output Type: 开漏；推挽式; Operating Temperature: -40℃~+85℃; Features: 自动方向检测
U9 = X1311FVS-07-C43D35R1: 插孔结构:1x7P;间距:1.27mm;行距:-;圆孔/方孔:方孔;安装类型:立贴;排数:单排;总孔位数:7P;额定电流:1A;额定电压:250V;插孔方向:顶部;塑高:4.3mm;触头材质:黄铜;触头镀层:金;工作温度范围:-40℃~+105℃;焊接温度(最大值):260℃;; LCSC Part Name: 间距:1.27mm 1x7P 立贴; Supplier Part: C2881497; Manufacturer: XKB Connectivity(中国星坤); Supplier Footprint: SMD,P=1.27mm(交错脚); JLCPCB Part Class: Extended Part; Datasheet: https://atta.szlcsc.com/upload/public/pdf/source/20211011/0A98DB21FA5DE73171AE3D6ADB4E7C8C.pdf; Supplier: LCSC; Holes Structure: 1x7P; Pitch: 1.27mm; Circular Hole / Square Hole: 方孔; Mounting Type: 立贴; Number of Rows: 单排; Number of Holes: 7P; Current Rating (Max): 1A; Voltage Rating (Max): 250V; Holes Direction: 顶部; Insulation Height: 4.3mm; Contact Material: 黄铜; Contact Plating: 金; Operating Temperature Range: -40℃~+105℃; Soldering Temperature(Max): 260℃
USB1 = TYPE-C 16PIN 2MD(073): 连接器类型:Type-C;标准:USB 3.1;公母:母;安装方式:卧贴;触点数量:16P;端口数量:1;额定电流 - 电源:5A;工作温度范围:-25℃~+85℃;; LCSC Part Name: Type-C 母 卧贴; Supplier Part: C2765186; Manufacturer: SHOU HAN(首韩); Supplier Footprint: SMD; JLCPCB Part Class: 扩展库; Datasheet: https://atta.szlcsc.com/upload/public/pdf/source/20211123/39B17C16241EAC15C5E277BDA434118E.pdf; Supplier: LCSC; Connector Type: Type-C; Standard: USB 3.1; Gender: 母; Mounting Style: 卧贴; Number of Contacts: 16P; Number of Ports: 1; Current Rating - Power (Max): 5A; Operating Temperature Range: -25℃~+85℃; Rated Voltage (Max): 5V; Connect-Disconnect Life: 5千次; Core Colour: 黑色
X1 = AFC07-S18ECA-00: 锁定特性:抽屉式;触点类型:上接;触点数量:18P;间距:0.5mm;安装类型:卧贴;工作温度范围:-;; LCSC Part Name: 间距:0.5mm P数:18P 抽屉式 上接; Supplier Part: C262640; Manufacturer: JS(钜硕电子); Supplier Footprint: SMD,P=0.5mm,卧贴; JLCPCB Part Class: 扩展库; Datasheet: https://atta.szlcsc.com/upload/public/pdf/source/20190726/C11082_A2E7B12387019CE4314BB5199EE0FDF4.pdf; Supplier: LCSC; Locking Feature: 抽屉式; Contact Type: 上接; Number of Contacts: 18P; Pitch: 0.5mm; Mounting Type: 卧贴; FFC, FCB Thickness: 0.3mm; Height Above Board: 2mm
C1 = CC0402JRNPO9BN150: 容值:15pF;精度:±5%;额定电压:50V;材质(温度系数):NP0;; LCSC Part Name: 15pF ±5% 50V; Supplier Part: C106997; Manufacturer: YAGEO(国巨); Supplier Footprint: 0402; JLCPCB Part Class: 扩展库; Datasheet: https://atta.szlcsc.com/upload/public/pdf/source/20170914/C128857_1505359892143968080.pdf; Supplier: LCSC; Tolerance: ±5%; Voltage Rated: 50V; Temperature Coefficient: NP0
C5 C7 = CL05A475MP5NRNC: 容值:4.7uF;精度:±20%;额定电压:10V;材质(温度系数):X5R;; LCSC Part Name: 4.7uF ±20% 10V; Supplier Part: C23733; Manufacturer: SAMSUNG(三星); Supplier Footprint: 0402; JLCPCB Part Class: 基础库; Datasheet: https://atta.szlcsc.com/upload/public/pdf/source/20160218/1457707763339.pdf; Supplier: LCSC; Tolerance: ±20%; Voltage Rated: 10V; Temperature Coefficient: X5R
C6 = CL05A225MQ5NSNC: 容值:2.2uF;精度:±20%;额定电压:6.3V;材质(温度系数):X5R;; LCSC Part Name: 2.2uF ±20% 6.3V; Supplier Part: C12530; Manufacturer: SAMSUNG(三星); Supplier Footprint: 0402; JLCPCB Part Class: Basic Part; Datasheet: https://atta.szlcsc.com/upload/public/pdf/source/20160218/1457707763339.pdf; Supplier: LCSC; Tolerance: ±20%; Voltage Rated: 6.3V; Temperature Coefficient: X5R
C10 = 0402CG220J500NT: 容值:22pF;精度:±5%;额定电压:50V;材质(温度系数):C0G;; LCSC Part Name: 22pF ±5% 50V; Supplier Part: C1555; Manufacturer: FH(风华); Supplier Footprint: 0402; Datasheet: https://atta.szlcsc.com/upload/public/pdf/source/20200305/C486355_26A10D38EF8C2A5C37091D0039909270.pdf; Supplier: LCSC; Tolerance: ±5%; Voltage Rated: 50V; Temperature Coefficient: C0G; Check: true
C11 C21 C24 = CL05A105KA5NQNC: 容值:1uF;精度:±10%;额定电压:25V;材质(温度系数):X5R;; LCSC Part Name: 1uF ±10% 25V; Supplier Part: C52923; Manufacturer: SAMSUNG(三星); Supplier Footprint: 0402; JLCPCB Part Class: Basic Part; Datasheet: https://atta.szlcsc.com/upload/public/pdf/source/20160218/1457707763339.pdf; Supplier: LCSC; Tolerance: ±10%; Voltage Rated: 25V; Temperature Coefficient: X5R
C12 C16 = 0402B472K500NT: 容值:4.7nF;精度:±10%;额定电压:50V;温度系数:X7R;; LCSC Part Name: 4.7nF ±10% 50V; Supplier Part: C1538; Manufacturer: FH(风华); Supplier Footprint: 0402; JLCPCB Part Class: Basic Part; Datasheet: https://atta.szlcsc.com/upload/public/pdf/source/20200305/C486355_26A10D38EF8C2A5C37091D0039909270.pdf; Supplier: LCSC; Tolerance: ±10%; Voltage Rating: 50V; Temperature Coefficient: X7R
C13 C17 = 0402B222K500NT: 容值:2.2nF;精度:±10%;额定电压:50V;材质(温度系数):X7R;; LCSC Part Name: 2.2nF ±10% 50V; Supplier Part: C1531; Manufacturer: FH(风华); Supplier Footprint: 0402; JLCPCB Part Class: Extended Part; Datasheet: https://atta.szlcsc.com/upload/public/pdf/source/20200305/C486355_26A10D38EF8C2A5C37091D0039909270.pdf; Supplier: LCSC; Tolerance: ±10%; Voltage Rated: 50V; Temperature Coefficient: X7R
C14 C15 C18 C19 = 0402B102K500NT: 容值:1nF;精度:±10%;额定电压:50V;材质(温度系数):X7R;; LCSC Part Name: 1nF ±10% 50V; Supplier Part: C1523; Manufacturer: FH(风华); Supplier Footprint: 0402; JLCPCB Part Class: Basic Part; Datasheet: https://atta.szlcsc.com/upload/public/pdf/source/20200305/C486355_26A10D38EF8C2A5C37091D0039909270.pdf; Supplier: LCSC; Tolerance: ±10%; Voltage Rated: 50V; Temperature Coefficient: X7R
C23 = CL05B104KB54PNC: 容值:100nF;精度:±10%;额定电压:50V;材质(温度系数):X7R;; LCSC Part Name: 100nF ±10% 50V; Supplier Part: C307331; Manufacturer: SAMSUNG(三星); Supplier Footprint: 0402; JLCPCB Part Class: 基础库; Datasheet: https://atta.szlcsc.com/upload/public/pdf/source/20160218/1457707763339.pdf; Supplier: LCSC; Tolerance: ±10%; Voltage Rated: 50V; Temperature Coefficient: X7R
R1 R2 R7 = 0402WGF2201TCE: 电阻类型:厚膜电阻;阻值:2.2kΩ;精度:±1%;功率:62.5mW;最大工作电压:50V;温度系数:±100ppm/℃;; LCSC Part Name: 2.2kΩ ±1% 62.5mW 厚膜电阻; Supplier Part: C25879; Manufacturer: UNI-ROYAL(厚声); Supplier Footprint: 0402; JLCPCB Part Class: 基础库; Datasheet: https://atta.szlcsc.com/upload/public/pdf/source/20200306/C422600_1E6D84923E4A46A82E41ADD87F860B5C.pdf; Supplier: LCSC; Type: 厚膜电阻; Tolerance: ±1%; Power(Watts): 62.5mW; Overload Voltage (Max): 50V; Temperature Coefficient: ±100ppm/℃; Operating Temperature Range: -55℃~+155℃
R4 = 0402WGF1503TCE: 电阻类型:厚膜电阻;阻值:150kΩ;精度:±1%;功率:62.5mW;最大工作电压:50V;温度系数:±100ppm/℃;; LCSC Part Name: 150kΩ ±1% 62.5mW 厚膜电阻; Supplier Part: C25755; Manufacturer: UNI-ROYAL(厚声); Supplier Footprint: 0402; JLCPCB Part Class: 扩展库; Datasheet: https://atta.szlcsc.com/upload/public/pdf/source/20200306/C422600_1E6D84923E4A46A82E41ADD87F860B5C.pdf; Supplier: LCSC; Type: 厚膜电阻; Tolerance: ±1%; Power(Watts): 62.5mW; Overload Voltage (Max): 50V; Temperature Coefficient: ±100ppm/℃; Operating Temperature Range: -55℃~+155℃
R5 = 0402WGF5602TCE: 电阻类型:厚膜电阻;阻值:56kΩ;精度:±1%;功率:62.5mW;最大工作电压:50V;温度系数:±100ppm/℃;; LCSC Part Name: 56kΩ ±1% 62.5mW 厚膜电阻; Supplier Part: C25796; Manufacturer: UNI-ROYAL(厚声); Supplier Footprint: 0402; JLCPCB Part Class: Extended Part; Datasheet: https://atta.szlcsc.com/upload/public/pdf/source/20200306/C422600_1E6D84923E4A46A82E41ADD87F860B5C.pdf; Supplier: LCSC; Type: 厚膜电阻; Tolerance: ±1%; Power(Watts): 62.5mW; Overload Voltage (Max): 50V; Temperature Coefficient: ±100ppm/℃; Operating Temperature Range: -55℃~+155℃
R6 = 0402WGF1501TCE: 电阻类型:厚膜电阻;阻值:1.5kΩ;精度:±1%;功率:62.5mW;最大工作电压:50V;温度系数:±100ppm/℃;; LCSC Part Name: 1.5kΩ ±1% 62.5mW 厚膜电阻; Supplier Part: C25867; Manufacturer: UNI-ROYAL(厚声); Supplier Footprint: 0402; JLCPCB Part Class: 基础库; Datasheet: https://atta.szlcsc.com/upload/public/pdf/source/20200306/C422600_1E6D84923E4A46A82E41ADD87F860B5C.pdf; Supplier: LCSC; Type: 厚膜电阻; Tolerance: ±1%; Power(Watts): 62.5mW; Overload Voltage (Max): 50V; Temperature Coefficient: ±100ppm/℃; Operating Temperature Range: -55℃~+155℃
R9 = FRC0402F8201TS: 电阻类型:厚膜电阻;阻值:8.2kΩ;精度:±1%;功率:62.5mW;最大工作电压:50V;温度系数:±100ppm/℃;; LCSC Part Name: 8.2kΩ ±1% 62.5mW 厚膜电阻; Supplier Part: C2909385; Manufacturer: FOJAN(富捷); Supplier Footprint: 0402; JLCPCB Part Class: Extended Part; Datasheet: https://atta.szlcsc.com/upload/public/pdf/source/20211221/925EC7D7225764EE0046F22065062C87.pdf; Supplier: LCSC; Type: 厚膜电阻; Tolerance: ±1%; Power(Watts): 62.5mW; Overload Voltage (Max): 50V; Temperature Coefficient: ±100ppm/℃; Operating Temperature Range: -55℃~+155℃
R10 = 0402WGF0000TCE: 电阻类型:厚膜电阻;阻值:0Ω;精度:±1%;功率:62.5mW;; LCSC Part Name: 0Ω ±1% 62.5mW; Supplier Part: C17168; Manufacturer: UNI-ROYAL(厚声); Supplier Footprint: 0402; Datasheet: https://atta.szlcsc.com/upload/public/pdf/source/20200306/C422600_1E6D84923E4A46A82E41ADD87F860B5C.pdf; Supplier: LCSC; Type: 厚膜电阻; Tolerance: ±1%; Power(Watts): 62.5mW; Temperature Coefficient: ±800ppm/℃; Overload Voltage (Max): 50V; Operating Temperature Range: -55℃~+155℃; Check: true
R14 = 0402WGF0000TCE: 电阻类型:厚膜电阻;阻值:0Ω;精度:±1%;功率:62.5mW;工作电压:50V;温度系数:±800ppm/℃;; LCSC Part Name: 0Ω ±1% 62.5mW; Supplier Part: C17168; Manufacturer: UNI-ROYAL(厚声); Supplier Footprint: 0402; JLCPCB Part Class: Basic Part; Datasheet: https://atta.szlcsc.com/upload/public/pdf/source/20200306/C422600_1E6D84923E4A46A82E41ADD87F860B5C.pdf; Supplier: LCSC; Type: 厚膜电阻; Tolerance: ±1%; Power(Watts): 62.5mW; Temperature Coefficient: ±800ppm/℃; Overload Voltage (Max): 50V; Operating Temperature Range: -55℃~+155℃; Voltage-Supply(Max): 50V; Operating Temperature: -55℃~+155℃; Check: false
R15-R20 = 0402WGF1001TCE: 电阻类型:厚膜电阻;阻值:1kΩ;精度:±1%;功率:62.5mW;最大工作电压:50V;温度系数:±100ppm/℃;; LCSC Part Name: 1kΩ ±1% 62.5mW 厚膜电阻; Supplier Part: C11702; Manufacturer: UNI-ROYAL(厚声); Supplier Footprint: 0402; JLCPCB Part Class: Basic Part; Datasheet: https://atta.szlcsc.com/upload/public/pdf/source/20200306/C422600_1E6D84923E4A46A82E41ADD87F860B5C.pdf; Supplier: LCSC; Type: 厚膜电阻; Tolerance: ±1%; Power(Watts): 62.5mW; Overload Voltage (Max): 50V; Temperature Coefficient: ±100ppm/℃; Operating Temperature Range: -55℃~+155℃
R21 = 0402WGF1002TCE: 电阻类型:厚膜电阻;阻值:10kΩ;精度:±1%;功率:62.5mW;温度系数:±100ppm/℃;; LCSC Part Name: 厚膜电阻 10kΩ ±1% 62.5mW; Supplier Part: C25744; Manufacturer: UNI-ROYAL(厚声); Supplier Footprint: 0402; JLCPCB Part Class: 基础库; Datasheet: https://atta.szlcsc.com/upload/public/pdf/source/20200306/C422600_1E6D84923E4A46A82E41ADD87F860B5C.pdf; Supplier: LCSC; Type: 厚膜电阻; Tolerance: ±1%; Power(Watts): 62.5mW; Temperature Coefficient: ±100ppm/℃; Overload Voltage (Max): 50V; Operating Temperature Range: -55℃~+155℃
R22 R23 = 0402WGF5102TCE: 电阻类型:厚膜电阻;阻值:51kΩ;精度:±1%;功率:62.5mW;最大工作电压:50V;温度系数:±100ppm/℃;; LCSC Part Name: 51kΩ ±1% 62.5mW 厚膜电阻; Supplier Part: C25794; Manufacturer: UNI-ROYAL(厚声); Supplier Footprint: 0402; JLCPCB Part Class: Basic Part; Datasheet: https://atta.szlcsc.com/upload/public/pdf/source/20200306/C422600_1E6D84923E4A46A82E41ADD87F860B5C.pdf; Supplier: LCSC; Type: 厚膜电阻; Tolerance: ±1%; Power(Watts): 62.5mW; Overload Voltage (Max): 50V; Temperature Coefficient: ±100ppm/℃; Operating Temperature Range: -55℃~+155℃
U1 = ESP32-C5-WROOM-1-N8R4: Manufacturer: ESPRESSIF(乐鑫); JLCPCB Part Class: 扩展库; Datasheet: https://atta.szlcsc.com/upload/public/pdf/source/20241030/28A96DE7ADA92974C13AF543C219F785.pdf; Supplier: LCSC; Check: false
U2 = LMV321IDBVR_C7972: 放大器数:单路;轨到轨:-;增益带宽积(GBP):1MHz;压摆率(SR):1V/us;输入偏置电流(Ib):15nA;; LCSC Part Name: 低电压轨到轨输出运算放大器; Supplier Part: C7972; Manufacturer: TI(德州仪器); Supplier Footprint: SOT-23-5; JLCPCB Part Class: 扩展库; Datasheet: https://www.ti.com/cn/lit/gpn/lmv321; Supplier: LCSC; Number of Circuits: 单路; Gain Bandwidth Product(GBP): 1MHz; Slew Rate(SR): 1V/us; Current - Input Bias(Ib): 15nA; Quiescent Current: 130uA; Output Current: 160mA; Operating Temperature: -40℃~+125℃
U3 = NS4150B_C189961: 功放类型:D类功放;输出功率:3Wx1@4Ω;; Supplier Part: C189961; Manufacturer: Nsiway(纳芯威); Supplier Footprint: MSOP-8; JLCPCB Part Class: 扩展库; Datasheet: https://atta.szlcsc.com/upload/public/pdf/source/20220916/DAE631F3909B9CBB38BDE76E3E6D5896.pdf; Supplier: LCSC; Type of Power Amplifier: D类功放; Output Power: 3Wx1@4Ω; Supply Voltage: 3V~5.25V

## Nets
GND: C2.2 C3.2 C4.1 C5.1 C8.2 C9.1 C10.1 C11.2 C12.1 C13.1 C14.1 C15.2 C16.2 C17.2 C18.2 C19.1 C21.1 C23.1 C24.1 C26.1 C27.1 C28.1 C29.1 C30.1 C31.1 C32.1 C33.1 C34.1 C35.1 C36.1 C37.1 C38.1 C39.1 CN1.3 CN1.4 CN2.3 CN2.4 CN4.4 CN4.5 CN4.6 CN5.4 CN5.5 CN5.6 CN6.3 CN6.4 CN6.5 CN7.2 CN7.3 CN7.4 D1.1 D2.1 D5.1 D6.1 D7.1 R8.1 R9.1 R10.1 R21.1 R24.1 R27.1 R28.2 R29.2 R30.1 R34.2 R37.1 R43.2 SW1.1 SW1.2 SW2.2 U1.1(GND) U1.28(GND) U1.29(GND) U1.30(GND) U1.31(GND) U1.32(GND) U1.33(GND) U1.34(GND) U1.35(GND) U1.36(GND) U1.37(GND) U2.2(GND) U3.7(GND) U4.2(GND) U5.1(GND) U6.1(GND) U7.2(GND) U8.1(GND) U9.3 U10.1(GND) USB1.1(GND) USB1.12(GND) USB1.13(SHELL) USB1.14(SHELL) X1.1 X1.5 X1.6 X1.12 X1.18 X1.19 X1.20
VBAT_IN: C32.2 CN7.1 Q1.3(D) U7.3(BAT)
VBUS: C33.2 D1.2 D4.2(A) LED1.3(A) Q1.1(G) R28.1 U7.4(VCC) USB1.2(VBUS) USB1.11(VBUS)
VCC_1V8: C29.2 R47.1 U6.2(VOUT)
VCC_3V3: C8.1 C9.2 C26.2 C27.2 C28.2 C30.2 C35.2 CN4.3 L1.1 LED1.4(A) Q2.2(S) R1.1 R2.1 R11.1 R12.1 R13.1 R25.1 R33.2 R40.2 R42.2 R45.2 R46.1 U1.2(3V3) U6.3(VIN)
VDD_SENSOR: C34.2 C36.2 Q3.2(G) Q3.5(G) R31.1 R32.1 R38.1 R39.1 R41.2 R44.2 R46.2 R47.2 U8.2(VREF1) U9.1 U9.2 U10.2(VREF1)
VIN: Q1.2(S) Q4.2(S) R26.2 U5.2(VDD)
AUDIO_3V3: C2.1 C3.1 C31.2 Q2.3(D) R5.2 R6.1 R35.1 U2.5(V+) X1.3 X1.4 X1.17
BM_CS: U1.12(IO10) U10.6(SCL2)
BM_G1: Q3.6(D) R12.2 R42.1 SW1.3 U1.15(IO28)
BM_G2: Q3.3(D) R45.1 U1.6(IO0)
BM_SCK/SCL: CN5.2 R1.2 U1.5(IO3) U8.6(SCL2) X1.13
BM_SDI/SDA: CN5.3 R2.2 U1.4(IO2) U8.5(SDA2) X1.14
BM_SDO: U1.11(IO9) U10.5(SDA2)
CHRG: R36.1 U7.1(CHRG#)
CS: CN3.1 R39.2 U10.3(SCL1)
ESP_EN: C11.1 R13.2 U1.3(EN)
ESP_RX0: D6.2 U1.24(RXD0) USB1.9(SBU1)
ESP_TX0: D7.2 U1.25(TXD0) USB1.3(SBU2)
EXT_IO1: C38.2 CN4.2 U1.17(IO4)
EXT_IO2: C37.2 CN4.1 R14.2
G1: Q3.1(S) R41.1 U9.5
G2: Q3.4(S) R44.1 U9.6
GPIO1: R21.2 U1.7(IO1) U3.1(CTRL)
GPIO5: Q2.1(G) R14.1 R43.1 U1.16(IO5)
GPIO6: C7.1 R5.1 R9.2 U1.8(IO6)
GPIO7: R15.1 U1.9(IO7)
GPIO8: R18.1 U1.10(IO8)
GPIO13: D5.2 U1.13(IO13) USB1.5(DN2) USB1.7(DN1)
GPIO14: D2.2 U1.14(IO14) USB1.6(DP1) USB1.8(DP2)
GPIO23: U1.21(IO23) X1.10
GPIO24: U1.23(IO24) X1.9
GPIO25: U1.26(IO25) X1.8
GPIO26: U1.27(IO26) X1.7
GPIO27: CN6.1 R11.2 U1.18(IO27)
LCD_RST: R35.2 X1.11 X1.15
LEDK: R30.2 X1.2
MIC_3V3: C4.2 R3.1 R6.2 R7.2
MIC_N: CN1.2 R10.2
MIC_P: C6.1 C10.2 CN1.1 R7.1
NS_PA_INN: C18.1 C22.1 R20.2
NS_PA_INP: C14.2 C20.1 R17.2
NS_PA_OUT+: C15.1 CN2.1 U3.8(VoP)
NS_PA_OUT-: C19.2 CN2.2 U3.5(VON)
SCK/SCL: CN3.2 R32.2 U8.3(SCL1)
SDI/SDA: CN3.4 R31.2 U8.4(SDA1)
SDO: CN3.3 R38.2 U10.4(SDA1)
VOUT: C23.2 C24.2 C39.2 CN5.1 CN6.2 D4.1(K) Q4.3(D) U3.6(VCC) U4.1(EN) U4.4(VIN)
$1N2273: L1.2 U4.3(SW)
$1N2274: R25.2 R29.1 U4.5(FB)
$1N6219: R24.2 USB1.4(CC1)
$1N6296: R27.2 USB1.10(CC2)
$1N16726: R33.1 U8.7(VREF2) U8.8(EN)
$1N17113: R40.1 U10.7(VREF2) U10.8(EN)
$1N47248: R34.1 U7.6(PROG)
$1N47251: LED1.2(K) R36.2
$1N51543: Q4.1(G) R26.1 U5.6(OUT)
$1N51545: SW2.4 U5.4(ONOFF)
$1N53905: LED1.1(K) R37.2
$2N12642: R23.2 U3.4(INN)
$2N12643: R22.2 U3.3(INP)
$2N12644: C21.2 U3.2(Bypass)
$2N12647: C22.2 R23.1
$2N12648: C20.2 R22.1
$2N12678: C12.2 R15.2 R16.1
$2N12679: C13.2 R16.2 R17.1
$2N12680: C16.1 R18.2 R19.1
$2N12681: C17.1 R19.2 R20.1
$2N12692: C5.2 R3.2 R8.2 U2.1(+)
$2N12693: C1.1 C6.2 R4.1 U2.3(-)
$2N12697: C1.2 C7.2 R4.2 U2.4(OUT)

Not connected (* = marked no-connect by the designer): CN3 5* 6* 7* 8* 9*; SW1 4*; SW2 1* 3*; U1 19(NC/IO15)* 20(NC)* 22(NC)*; U5 3(NC)* 5(NC)*; U7 5(STDBY#)*; U9 4* 7*; X1 16*

## Notes on the sheets
sheet 1
- USB-C
- Power On/Off Management
- VIN -> 3V3
- BOOT Button
- 3V3 -> 1V8
- Vout = 0.6 x  (1 + R25/R29) = 3.315V
- Screen
- Bat Charge
- Shuttle Board
- External Interface
- External GPIO
- I2C
- WS2812
- VBAT
sheet 2
- ESP Button
- MCU
- MIC
- I2C
- USB
- UART
- Audio
- ADC CHAN5
- LCD
- Shuttle Board
- C5 Boot Mode
- PA
- ADC
- WS2812
- POWER CTRL
- Gain = 240/51 = 7.2
sheet 3
- ESP32-C5-WROOM-1-N16R8
- PDM
- PA
- NS4150B
- Type C for debug and
   function expansion
- D+/D-
- Speaker
- External
  Interface
- VBUS
- VIN
- DC-DC
- VCC_3V3
- I2C
- BME690
  ShuttleBoard
- PWR_EN
- Battery
  Manage
- ShuttleBoard
  Interface
- 1.83-Inch
  LCD
- SAM8108
- BMI270 & BMM350
  ShuttleBoard
- ESP32-C5
- SPI
- VBAT_IN
- Battery
- POWER-SW
- VDD_SENSOR
- POWER_CTRL
- MOS
- VCC_1V8
- External Interface
- ADC
- 3V3->1V8
- VCC_3V3
- OPA
- MIC
- WS2812B
- BOOT
- ESP-SensairShuttle-MainBoard
